# Altium schematic sheet PCIe.SchDoc: PCIe
size A3; Organization: Altium Limited; Address1: L3, 12a Rodborough Rd; Address2: Frenchs Forest; Address3: NSW; Address4: Australia 2086
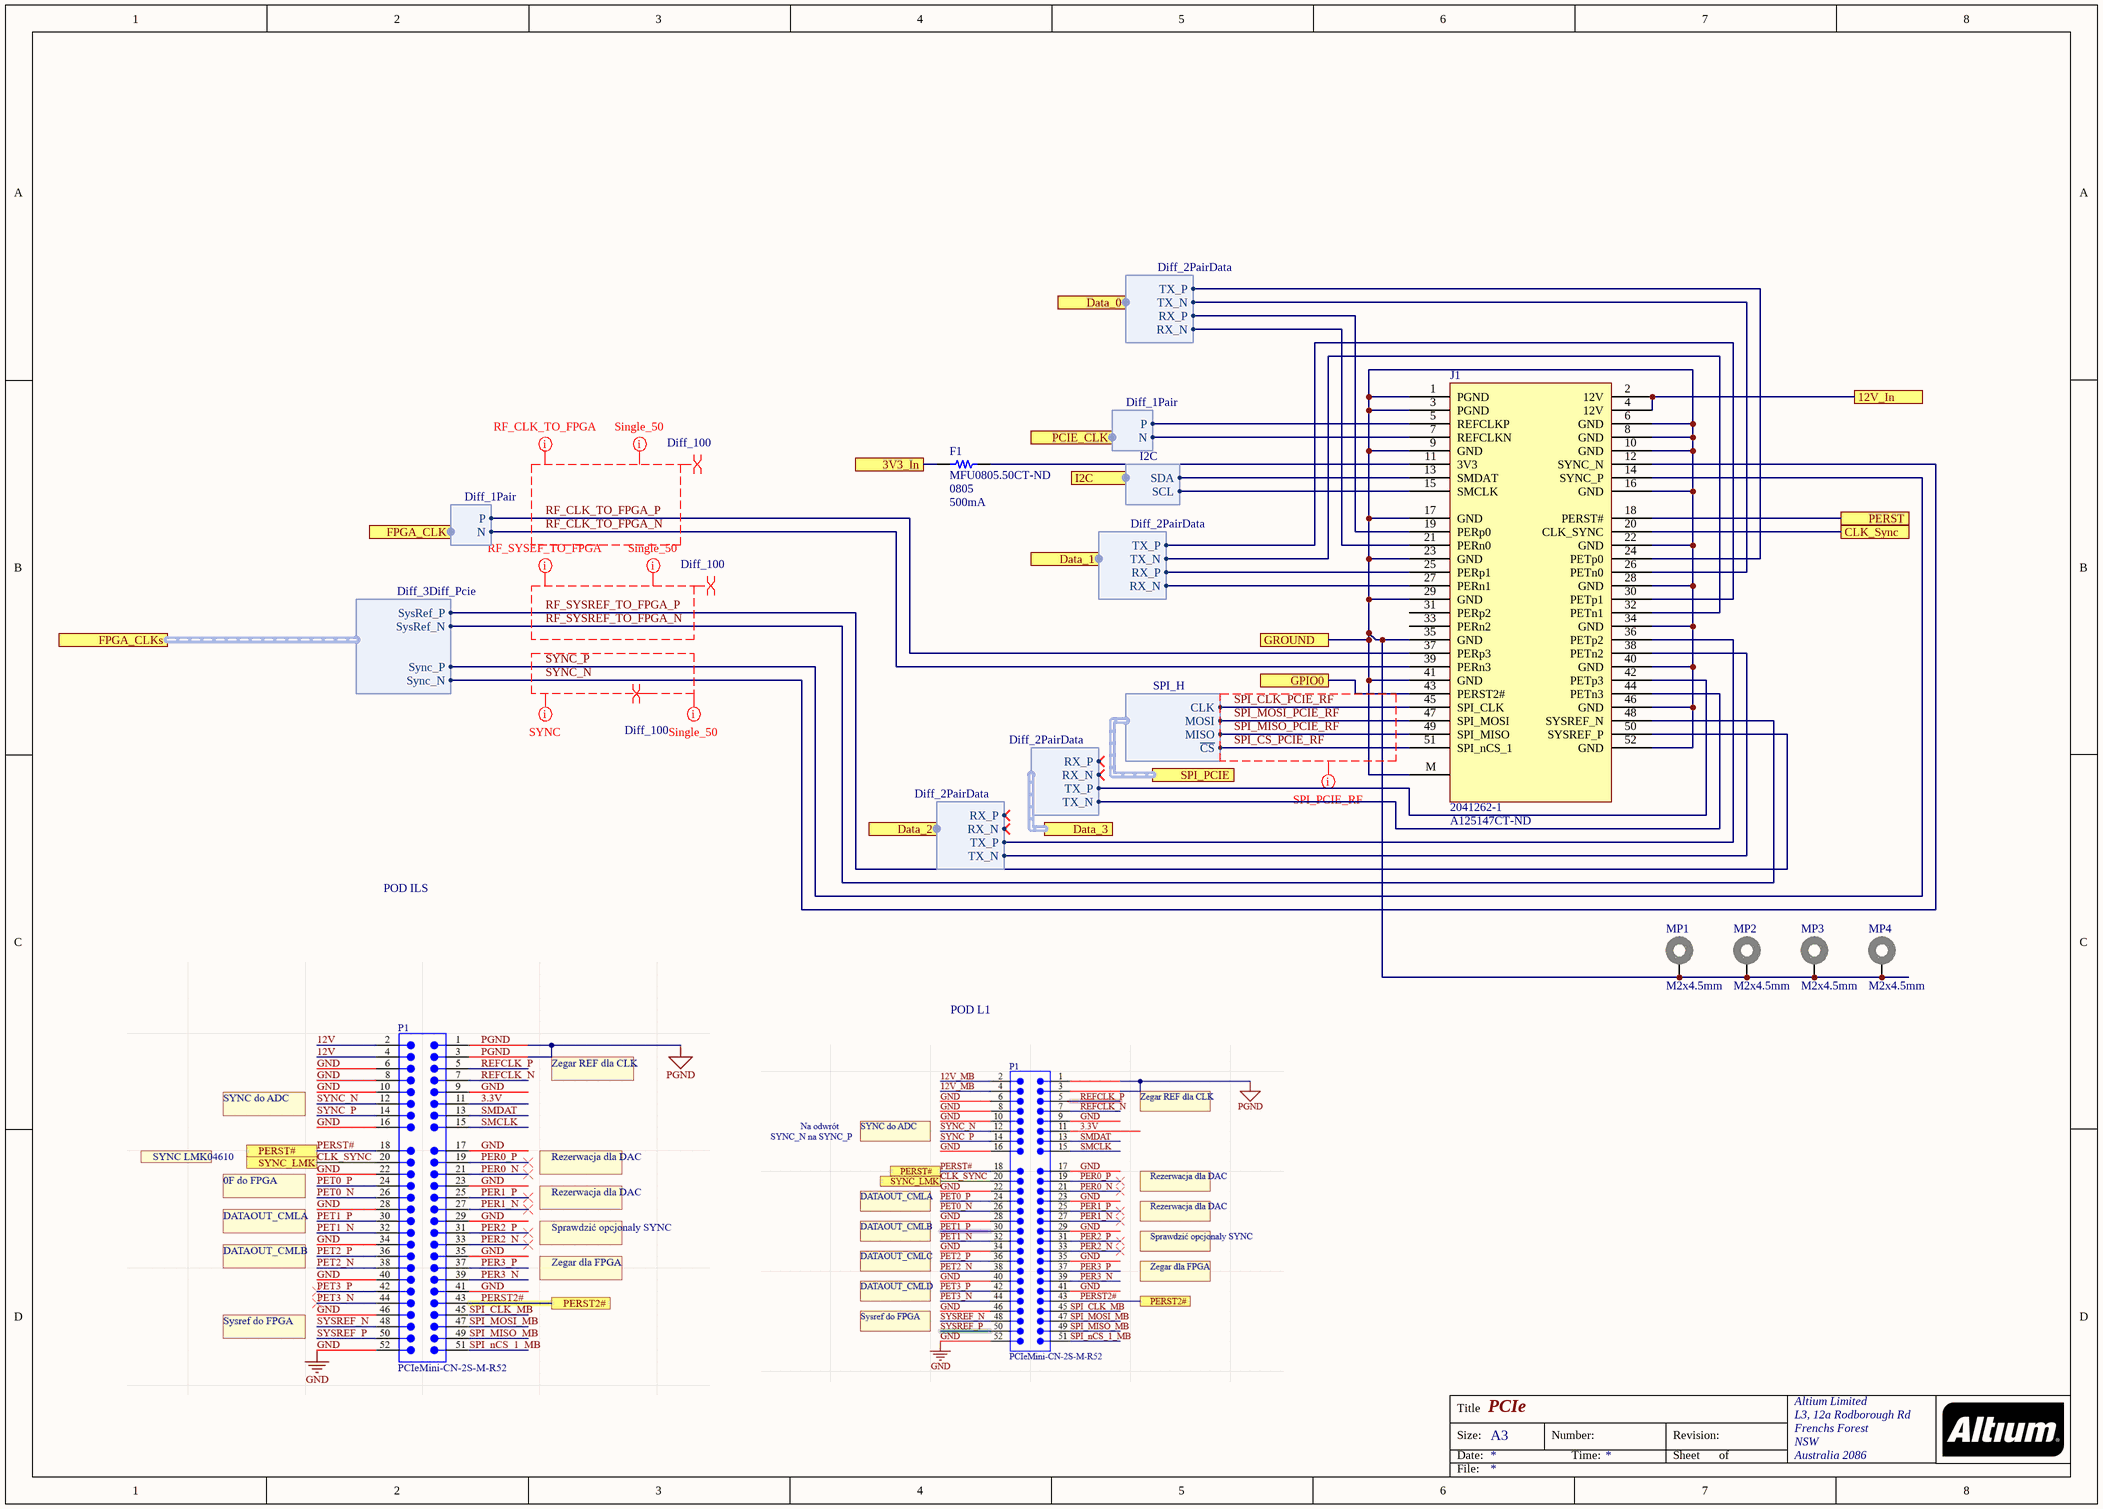
[diagram p0: PCIe.SchDoc]

## Parts
F1  Supplier Part Number 1: MFU0805.50CT-ND  Case Code (Imperial): 0805  Fuse Current: 500mA  [RES 0805/2012 RF]
J1  2041262-1  Supplier Part Number 1: A125147CT-ND  [PCI Express / PCI Connectors Mini PCI-E 6.8H G/F]
MP1  M2x4.5mm  [9774045243 - dual side copper]
MP2  M2x4.5mm  [9774045243 - dual side copper]
MP3  M2x4.5mm  [9774045243 - dual side copper]
MP4  M2x4.5mm  [9774045243 - dual side copper]

## Ports
3V3_In, 12V_In, CLK_Sync, Data_0 (harness Diff_2PairData), Data_1 (harness Diff_2PairData), Data_2 (harness Diff_2PairData), Data_3 (harness Diff_2PairData), FPGA_CLK (harness Diff_1Pair), FPGA_CLKs (harness Diff_3Diff_Pcie), GPIO0, GROUND, I2C (harness I2C), PCIE_CLK (harness Diff_1Pair), PERST, SPI_PCIE (harness SPI_H)

## Harnesses
I2C: SDA, SCL
SPI_H: CLK, MISO, MOSI, ~{CS}
Diff_2PairData: RX_P, RX_N, TX_P, TX_N
Diff_1Pair: N, P
Diff_3Diff_Pcie: SysRef_N, SysRef_P, Sync_P, Sync_N

## Nets
3V3_In: F1.2 ; port 3V3_In
12V_In: J1.2(12V) J1.4(12V) ; port 12V_In
CLK_Sync: J1.20(CLK_SYNC) ; port CLK_Sync
GPIO0: J1.43(PERST2#) ; port GPIO0
GROUND: J1.1(PGND) J1.3(PGND) J1.6(GND) J1.8(GND) J1.9(GND) J1.10(GND) J1.16(GND) J1.17(GND) J1.22(GND) J1.23(GND) J1.28(GND) J1.29(GND) J1.34(GND) J1.35(GND) J1.40(GND) J1.41(GND) J1.46(GND) J1.52(GND) J1.M MP1.1 MP2.1 MP3.1 MP4.1 ; port GROUND
PERST: J1.18(PERST#) ; port PERST
RF_CLK_TO_FPGA_N: J1.39(PERn3) ; port FPGA_CLK.N
RF_CLK_TO_FPGA_P: J1.37(PERp3) ; port FPGA_CLK.P
RF_SYSREF_TO_FPGA_N: J1.48(SYSREF_N) ; port FPGA_CLKs.SysRef_N
RF_SYSREF_TO_FPGA_P: J1.50(SYSREF_P) ; port FPGA_CLKs.SysRef_P
SPI_~{CS}_PCIE_RF: J1.51(SPI_nCS_1) ; port SPI_PCIE.~{CS}
SPI_CLK_PCIE_RF: J1.45(SPI_CLK) ; port SPI_PCIE.CLK
SPI_MISO_PCIE_RF: J1.49(SPI_MISO) ; port SPI_PCIE.MISO
SPI_MOSI_PCIE_RF: J1.47(SPI_MOSI) ; port SPI_PCIE.MOSI
SYNC_N: J1.12(SYNC_N) ; port FPGA_CLKs.Sync_N
SYNC_P: J1.14(SYNC_P) ; port FPGA_CLKs.Sync_P
NetF1_1: F1.1 J1.11(3V3)
NetJ1_5: J1.5(REFCLKP) ; port PCIE_CLK.P
NetJ1_7: J1.7(REFCLKN) ; port PCIE_CLK.N
NetJ1_13: J1.13(SMDAT) ; port I2C.SDA
NetJ1_15: J1.15(SMCLK) ; port I2C.SCL
NetJ1_19: J1.19(PERp0) ; port Data_0.RX_P
NetJ1_21: J1.21(PERn0) ; port Data_0.RX_N
NetJ1_24: J1.24(PETp0) ; port Data_0.TX_P
NetJ1_25: J1.25(PERp1) ; port Data_1.RX_P
NetJ1_26: J1.26(PETn0) ; port Data_0.TX_N
NetJ1_27: J1.27(PERn1) ; port Data_1.RX_N
NetJ1_30: J1.30(PETp1) ; port Data_1.TX_P
NetJ1_32: J1.32(PETn1) ; port Data_1.TX_N
NetJ1_36: J1.36(PETp2) ; port Data_2.TX_P
NetJ1_38: J1.38(PETn2) ; port Data_2.TX_N
NetJ1_42: J1.42(PETp3) ; port Data_3.TX_P
NetJ1_44: J1.44(PETn3) ; port Data_3.TX_N

Not connected (* = marked no-connect by the designer): J1 31(PERp2) 33(PERn2)

## Layout directives
mark named RF_CLK_TO_FPGA: RF_CLK_TO_FPGA_N, RF_CLK_TO_FPGA_P
net class RF_SYSEF_TO_FPGA*: RF_SYSREF_TO_FPGA_N, RF_SYSREF_TO_FPGA_P
net class SYNC: SYNC_N, SYNC_P
differential pair; differential pair class Diff_100: RF_CLK_TO_FPGA_N, RF_CLK_TO_FPGA_P, RF_SYSREF_TO_FPGA_N, RF_SYSREF_TO_FPGA_P, SYNC_N, SYNC_P
net class Single_50: RF_CLK_TO_FPGA_N, RF_CLK_TO_FPGA_P, RF_SYSREF_TO_FPGA_N, RF_SYSREF_TO_FPGA_P, SYNC_N, SYNC_P
net class SPI_PCIE_RF: SPI_CLK_PCIE_RF, SPI_MISO_PCIE_RF, SPI_MOSI_PCIE_RF, SPI_~{CS}_PCIE_RF

## Notes on the sheet
- POD ILS
- POD L1
- Title
- Size:
- Date:
- A3
- Number:
- Time:
- Revision:
- Sheet
- of
- File:

## Library data of the parts
F1 = Resistor: FUSE BOARD MNT 500MA 32VDC 0805; Manufacturer: Vishay; Manufacturer Part Number: MFU0805FF00500P100; DC Cold Resistance: 570mR; Working Voltage: 32V; Fuse Type: Board Mount (Cartridge Style Excluded); Approvals: UL; Supplier 1: Digi-Key; RoHS: Yes; Category: Fuses; Stock 1: 14752; Pricing 1: 1=0,63000, 5=0,60800, 10=0,58900, 50=0,49560, 100=0,41140, 250=0,37400, 500=0,31790 (USD); Mount: Surface Mount; Case/Package: SMD/SMT; Number of Pins: 2; Case Code (Metric): 2012; Housing Material: Ceramic; Min Operating Temperature: -55°C; Max Operating Temperature: 125°C; Current Rating: 500mA; Package Quantity: 1000; Voltage Rating (DC): 32V; Packaging: Tape and Reel; Length: 0.079inch; Height: 0.018inch; Depth: 1.25mm; Width: 0.049inch; Radiation Hardening: No; REACH SVHC: No SVHC; ComponentLink1URL: https://datasheet.ciiva.com/7650/mfuserie-7650777.pdf?src-supplier=Element14; ComponentLink1Description: https://datasheet.ciiva.com/7650/mfuserie-7650777.pdf?src-supplier=Element14; ComponentLink2URL: https://datasheet.ciiva.com/16393/mfuserie-16393883.pdf?src-supplier=Future+Electronics; ComponentLink2Description: https://datasheet.ciiva.com/16393/mfuserie-16393883.pdf?src-supplier=Future+Electronics; ComponentLink3URL: https://datasheet.ciiva.com/8057/1480005-8057902.pdf?src-supplier=Element14; ComponentLink3Description: https://datasheet.ciiva.com/8057/1480005-8057902.pdf?src-supplier=Element14; ComponentLink4URL: https://datasheet.ciiva.com/11337/mfuserie-11337759.pdf?src-supplier=Avnet; ComponentLink4Description: https://datasheet.ciiva.com/11337/mfuserie-11337759.pdf?src-supplier=Avnet
J1 = 2041262-1: PCI Express / PCI Connectors Mini PCI-E 6.8H G/F; Manufacturer: TE Connectivity AMP; Connector Type: Receptacle; Number of Contacts: 52; High Temperature Housing: Yes; PCB Mount Retention: Without; PCB Mounting Orientation: Horizontal; Stackable: No; Pitch: 0.8mm; Row Spacing: 0.031inch; Stack Height: 0.268inch; Supplier 1: Digi-Key; Manufacturer Part Number: 2041262-1; RoHS: Yes; Category: Card Edge Connectors; Stock 1: 33744; Pricing 1: 1=1,04000, 10=0,91200, 25=0,85840, 50=0,82260, 100=0,78680 (USD); Mount: Surface Mount; Number of Pins: 52; Housing Material: Thermoplastic; Contact Material: Copper Alloy; Housing Color: Black; Contact Plating: Gold; Min Operating Temperature: -55°C; Max Operating Temperature: 85°C; Number of Rows: 2; Termination: Solder; Number of Positions: 52; Package Quantity: 450; Orientation: Right Angle; Packaging: Tape and Reel; Flammability Rating: UL94 V-0; Lead Free: Lead Free; ELV: Compliant; ComponentLink1URL: https://www.mouser.com/ds/2/418/NG_DS_8-1773459-7_EXPRESS_MINI_CARD_QRG_0816-907003.pdf?src-supplier=Mouser; ComponentLink1Description: https://www.mouser.com/ds/2/418/NG_DS_8-1773459-7_EXPRESS_MINI_CARD_QRG_0816-907003.pdf?src-supplier=Mouser; ComponentLink2URL: https://www.te.com/commerce/DocumentDelivery/DDEController?Action=srchrtrv&DocNm=108-99102&DocType=SS&DocLang=EN&src-supplier=Digi-Key; ComponentLink2Description: https://www.te.com/commerce/DocumentDelivery/DDEController?Action=srchrtrv&DocNm=108-99102&DocType=SS&DocLang=EN&src-supplier=Digi-Key; ComponentLink3URL: https://www.te.com/commerce/DocumentDelivery/DDEController?Action=srchrtrv&amp;DocNm=2041262&amp;DocType=Customer+Drawing&amp;DocLang=English&src-supplier=Digi-Key; ComponentLink3Description: https://www.te.com/commerce/DocumentDelivery/DDEController?Action=srchrtrv&amp;DocNm=2041262&amp;DocType=Customer+Drawing&amp;DocLang=English&src-supplier=Digi-Key; ComponentLink4URL: http://www.te.com/commerce/DocumentDelivery/DDEController?Action=srchrtrv&DocNm=2041262&DocType=Customer+Drawing&DocLang=English&src-supplier=Digi-Key; ComponentLink4Description: http://www.te.com/commerce/DocumentDelivery/DDEController?Action=srchrtrv&DocNm=2041262&DocType=Customer+Drawing&DocLang=English&src-supplier=Digi-Key; ComponentLink5URL: http://www.te.com/commerce/DocumentDelivery/DDEController?Action=showdoc&DocId=Customer+Drawing%7F2041262%7FC%7Fpdf%7FEnglish%7FENG_CD_2041262_C.pdf&src-supplier=Avnet; ComponentLink5Description: http://www.te.com/commerce/DocumentDelivery/DDEController?Action=showdoc&DocId=Customer+Drawing%7F2041262%7FC%7Fpdf%7FEnglish%7FENG_CD_2041262_C.pdf&src-supplier=Avnet
MP1-MP4 = 9774045243R: WA-SMSI SMT Steel Spacer, OD4.35mm, M2x4.5mm; Inner Diameter: 2.8mm; Outer Diameter: 4.35mm; Surface: Tin; Thread: M2; ComponentLink1Description: Manufacturer; ComponentLink1URL: http://www.we-online.de; ComponentLink2Description: Datasheet; ComponentLink2URL: https://katalog.we-online.com/em/datasheet/9774045243R.pdf; Mounting Technology: SMT; Packaging: Tape and Reel; Part Number: 9774045243R; Length: 4.5mm; Inner Thread Length: -; Operating Temperature: -55 to +150degC; Publisher: Wurth Elektronik; Published Date: September 2019; Material: Steel